# Altium project lga1700.PrjPCB (part 7 of 11)

## Sheet LAN - RTL8111H.schdoc
size 420 x 298 mm; Symbol: Sheet-Symbol_A3; Company: 嘉立创EDA; Version: V1.0; Page Size: A3; @Project Name: 【全网首发】X86电脑主板_copy; @Page Count: 15; @Update Date: 2025-10-09; @Create Date: 2025-10-09; @Schematic Name: SCHEMATIC1_1; @Page No: 0; @Page Name: LAN - RTL8111H; Device: Sheet-Symbol_A3
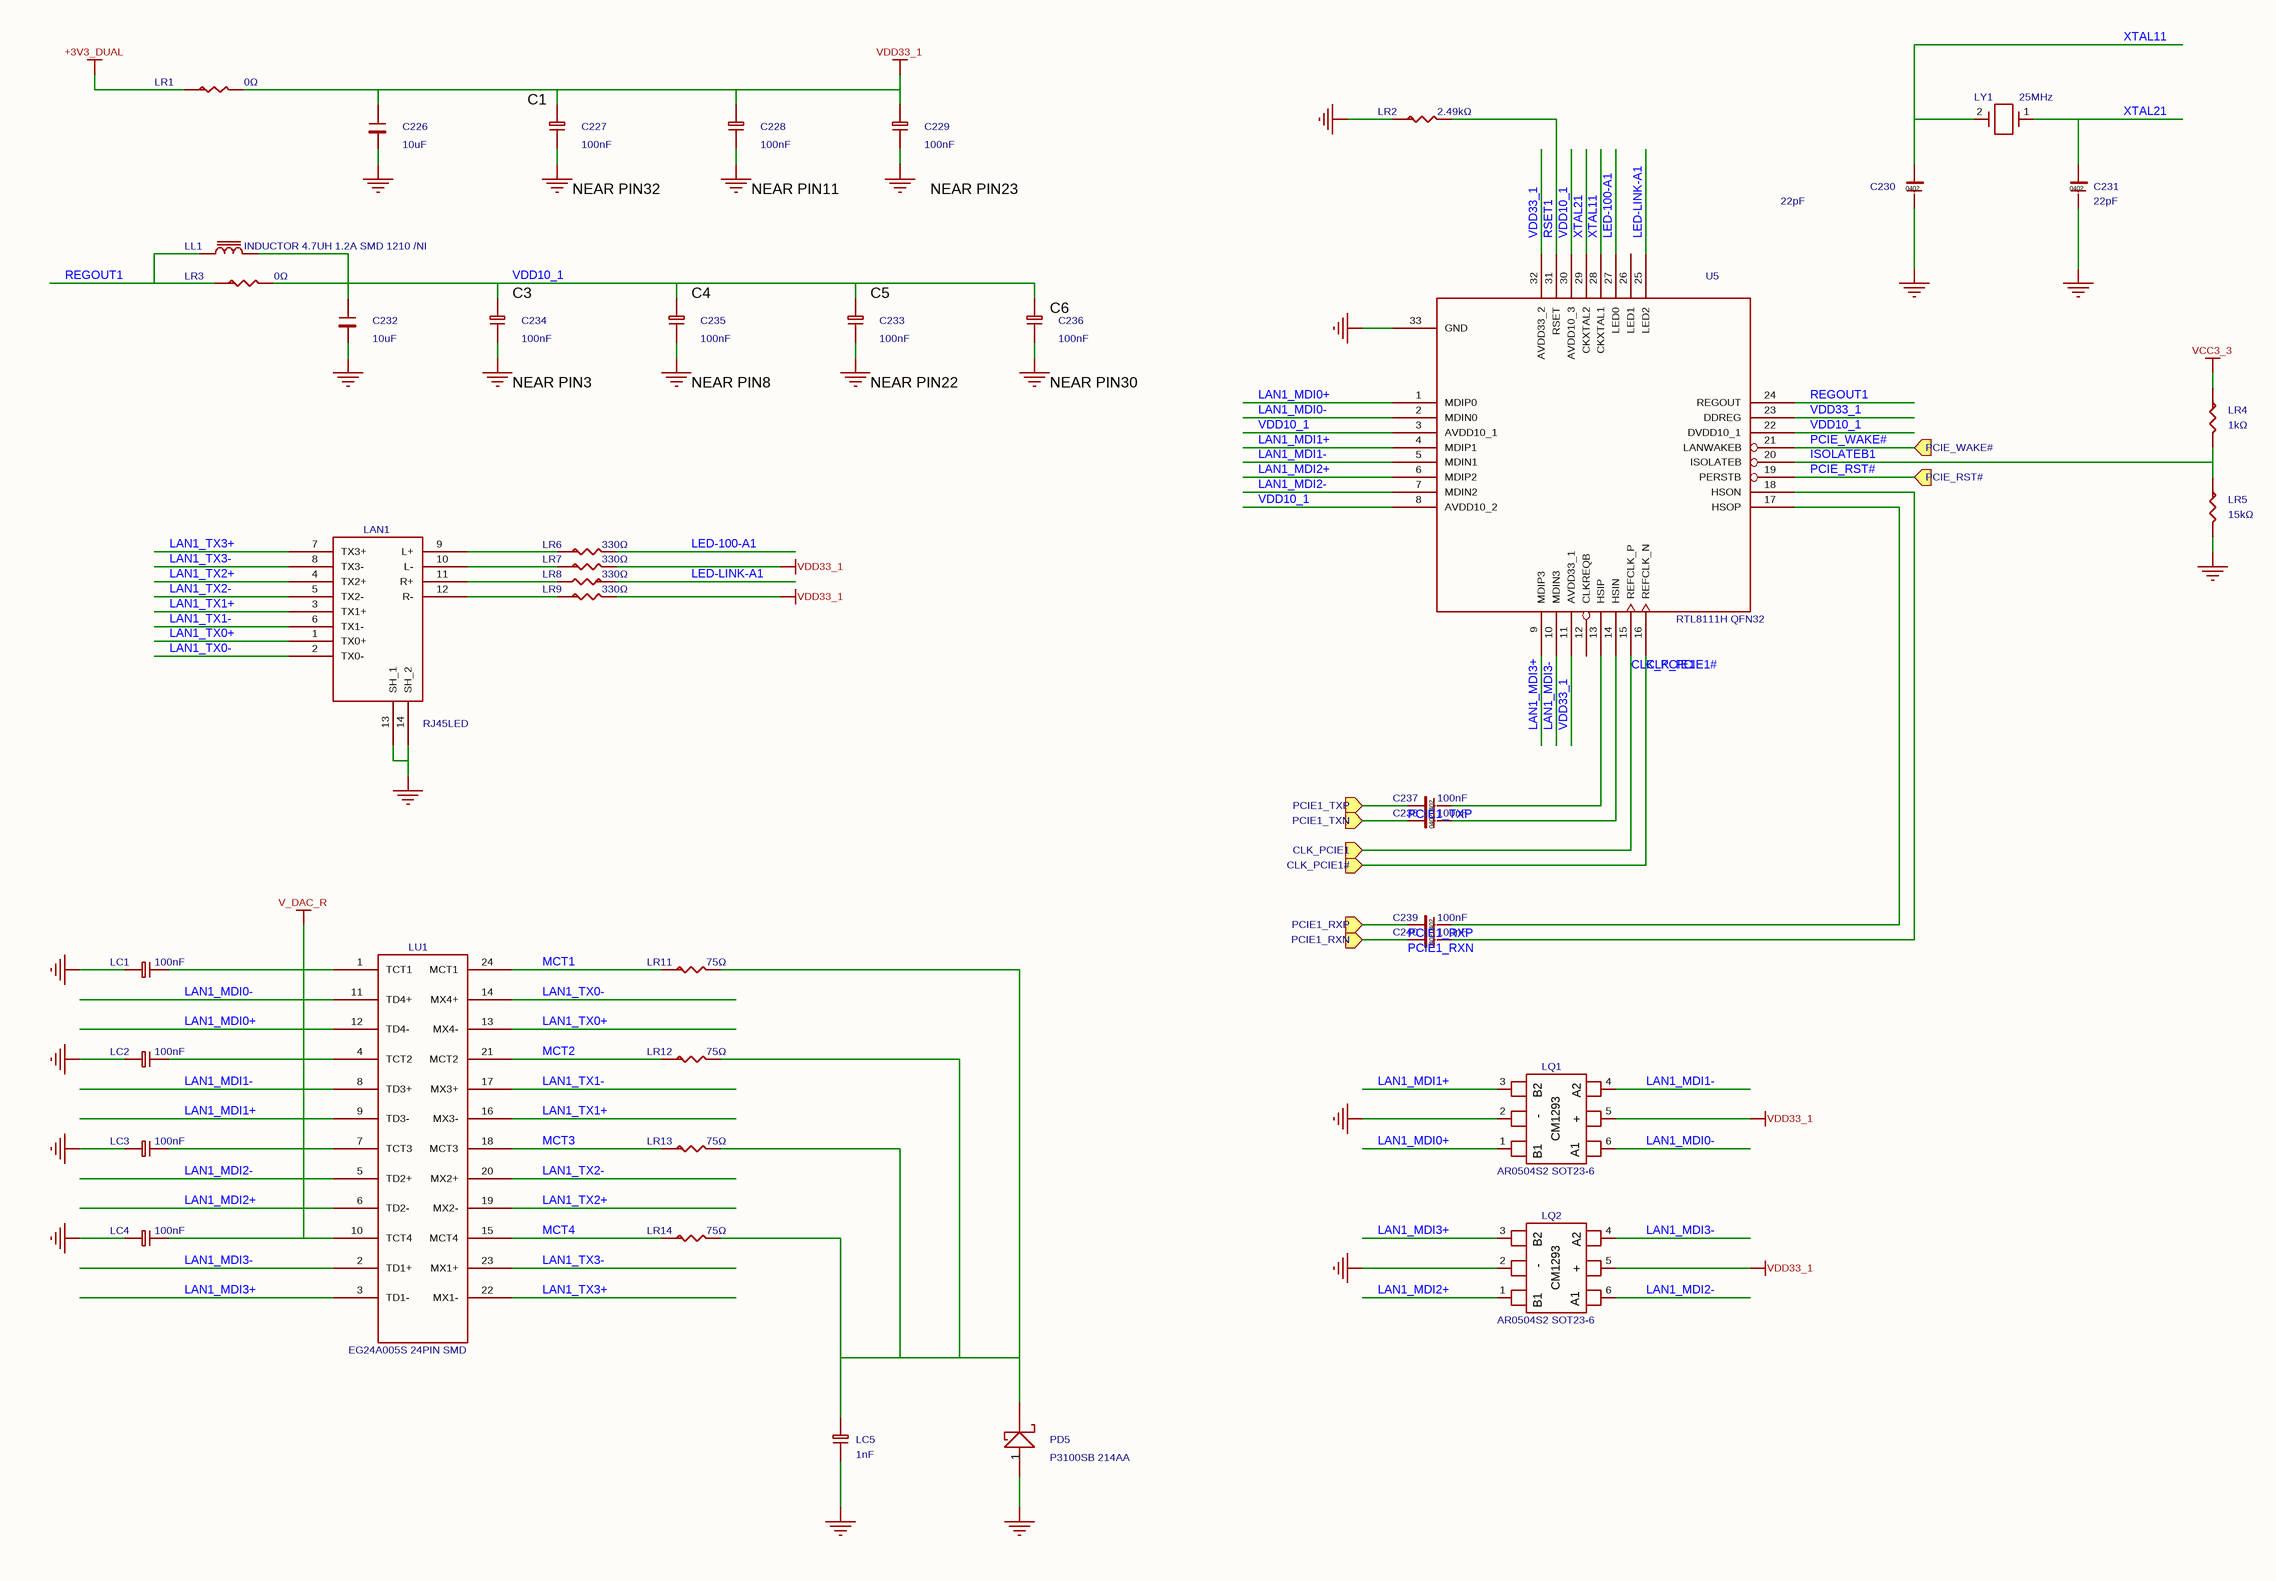
[diagram p25: LAN - RTL8111H.schdoc]

### Parts
C226  10uF  [C0603]
C227  100nF  [C0402]
C228  100nF  [C0402_3]
C229  100nF  [C0402_2]
C230  22pF  [C0402]
C231  22pF  [C0402]
C232  10uF  [C0603_3]
C233  100nF  [C0402_3]
C234  100nF  [C0402_2]
C235  100nF  [C0402_1]
C236  100nF  [C0402_1]
C237  100nF  [C0402_3]
C238  100nF  [C0402_3]
C239  100nF  [C0402_3]
C240  100nF  [C0402_3]
LAN1  value RJ45LED  [RJ45_LED]  (hidden comment: R-RJ45R08P-C000)
LC1  100nF  [C0402]
LC2  100nF  [C0402]
LC3  100nF  [C0402]
LC4  100nF  [C0402]
LC5  1nF  [C1206]
LL1  value INDUCTOR 4.7UH 1.2A SMD 1210 /NI  [L1210H22]  (hidden comment: INDUCTOR_0)
LQ1  value AR0504S2 SOT23-6  [SOT23-6P-20051228]  (hidden comment: SRV05-4)
LQ2  value AR0504S2 SOT23-6  [SOT23-6P-20051228]  (hidden comment: SRV05-4)
LR1  0Ω  [R0603]
LR2  2.49kΩ  [R0402]
LR3  0Ω  [R0603_1]
LR4  1kΩ  [R0402_1]
LR5  15kΩ  [R0402_3]
LR6  330Ω  [R0402_3]
LR7  330Ω  [R0402_1]
LR8  330Ω  [R0402_1]
LR9  330Ω  [R0402_1]
LR11  75Ω  [R0402_3]
LR12  75Ω  [R0402_1]
LR13  75Ω  [R0402_1]
LR14  75Ω  [R0402_1]
LU1  value EG24A005S 24PIN SMD  [TRAN24_100_150]  (hidden comment: RJ45LED_3)
LY1  25MHz  [XD2]
PD5  value P3100SB 214AA  [DIODE_1N5817]  (hidden comment: P3100SB)
U5  value RTL8111H QFN32  [RTL8111G_QFN32]  (hidden comment: RTL8111H-CG)

### Ports
CLK_PCIE1 (in), CLK_PCIE1# (in), PCIE1_RXN (in), PCIE1_RXP (in), PCIE1_TXN (in), PCIE1_TXP (in), PCIE_RST# (in), PCIE_WAKE# (in)

### Nets
+3V3_DUAL: LR1.1
GND: C226.1 C227.1 C228.1 C229.1 C230.2 C231.2 C232.1 C233.1 C234.1 C235.1 C236.1 LAN1.13(SH_1) LAN1.14(SH_2) LC1.2 LC2.2 LC3.2 LC4.2 LC5.1 LQ1.2 LQ2.2 LR2.1 LR5.2 PD5.1(A) U5.33(GND)
V_DAC_R: LC1.1 LC2.1 LC3.1 LC4.1 LU1.1(TCT1) LU1.4(TCT2) LU1.7(TCT3) LU1.10(TCT4)
VCC3_3: LR4.1
VDD33_1: C226.2 C227.2 C228.2 C229.2 LQ1.5(+) LQ2.5(+) LR1.2 LR7.2 LR9.2 U5.11(AVDD33_1) U5.23(DDREG) U5.32(AVDD33_2)
CLK_PCIE1: U5.15(REFCLK_P) ; port CLK_PCIE1
CLK_PCIE1#: U5.16(REFCLK_N) ; port CLK_PCIE1#
ISOLATEB1: LR4.2 LR5.1 U5.20(ISOLATEB)
LAN1_MDI0+: LQ1.1 LU1.12(TD4-) U5.1(MDIP0)
LAN1_MDI0-: LQ1.6 LU1.11(TD4+) U5.2(MDIN0)
LAN1_MDI1+: LQ1.3 LU1.9(TD3-) U5.4(MDIP1)
LAN1_MDI1-: LQ1.4 LU1.8(TD3+) U5.5(MDIN1)
LAN1_MDI2+: LQ2.1 LU1.6(TD2-) U5.6(MDIP2)
LAN1_MDI2-: LQ2.6 LU1.5(TD2+) U5.7(MDIN2)
LAN1_MDI3+: LQ2.3 LU1.3(TD1-) U5.9(MDIP3)
LAN1_MDI3-: LQ2.4 LU1.2(TD1+) U5.10(MDIN3)
LAN1_TX0+: LAN1.1(TX0+) LU1.13(MX4-)
LAN1_TX0-: LAN1.2(TX0-) LU1.14(MX4+)
LAN1_TX1+: LAN1.3(TX1+) LU1.16(MX3-)
LAN1_TX1-: LAN1.6(TX1-) LU1.17(MX3+)
LAN1_TX2+: LAN1.4(TX2+) LU1.19(MX2-)
LAN1_TX2-: LAN1.5(TX2-) LU1.20(MX2+)
LAN1_TX3+: LAN1.7(TX3+) LU1.22(MX1-)
LAN1_TX3-: LAN1.8(TX3-) LU1.23(MX1+)
LED-100-A1: LR6.2 U5.27(LED0)
LED-LINK-A1: LR8.1 U5.25(LED2)
MCT1: LR11.1 LU1.24(MCT1)
MCT2: LR12.1 LU1.21(MCT2)
MCT3: LR13.1 LU1.18(MCT3)
MCT4: LR14.1 LU1.15(MCT4)
PCIE1_RXN: C240.1 ; port PCIE1_RXN
PCIE1_RXP: C239.1 ; port PCIE1_RXP
PCIE1_TXN: C238.1 ; port PCIE1_TXN
PCIE1_TXP: C237.1 ; port PCIE1_TXP
PCIE_RST#: U5.19(PERSTB) ; port PCIE_RST#
PCIE_WAKE#: U5.21(LANWAKEB) ; port PCIE_WAKE#
REGOUT1: LL1.1 LR3.1 U5.24(REGOUT)
RSET1: LR2.2 U5.31(RSET)
VDD10_1: C232.2 C233.2 C234.2 C235.2 C236.2 LL1.2 LR3.2 U5.3(AVDD10_1) U5.8(AVDD10_2) U5.22(DVDD10_1) U5.30(AVDD10_3)
XTAL11: C230.1 LY1.2 U5.28(CKXTAL1)
XTAL21: C231.1 LY1.1 U5.29(CKXTAL2)
NetC237_2: C237.2 U5.13(HSIP)
NetC238_2: C238.2 U5.14(HSIN)
NetC239_2: C239.2 U5.17(HSOP)
NetC240_2: C240.2 U5.18(HSON)
NetLAN1_9: LAN1.9(L+) LR6.1
NetLAN1_10: LAN1.10(L-) LR7.1
NetLAN1_11: LAN1.11(R+) LR8.2
NetLAN1_12: LAN1.12(R-) LR9.1
NetLC5_2: LC5.2 LR11.2 LR12.2 LR13.2 LR14.2 PD5.2(C)

Not connected (* = marked no-connect by the designer): U5 12(CLKREQB) 26(LED1)

### Notes on the sheet
- (near C227) C1
- (near C227) NEAR PIN32
- (near C228) NEAR PIN11
- (near C229) NEAR PIN23
- (near C234) C3
- (near C235) C4
- (near C233) C5
- (near C236) C6
- (near C234) NEAR PIN3
- (near C235) NEAR PIN8
- (near C233) NEAR PIN22
- (near C236) NEAR PIN30
- 更新日期
- 2025-10-09
- 原理图
- 图页
- SCHEMATIC1_1
- LAN - RTL8111H
- 创建日期
- 物料编码
- 审阅
- 绘制
- 【全网首发】X86电脑主板_copy
- 版本
- V1.0
- 尺寸
- A3
- 页
- 0
- 嘉立创EDA
- 共
- 15
- (in symbol SRV05-4_C558418) B2; A2; CM1293; -; B1; A1

### Library data of the parts
C226 C232 = CL10A106KP8NNNC: 容值:10uF;精度:±10%;额定电压:10V;材质(温度系数):X5R;; Manufacturer: SAMSUNG(三星); Symbol: C0805; ModelId: ac125912035d415993ca9572d50418b1; Tolerance: ±10%; AddInBom: yes; Voltage Rated: 10V; ModelName: C0603_L1.6-W0.8-H0.8; ModelTransform: 62.992,31.496,0,0,0,0,0,0,0; Temperature Coefficient: X5R; Device: CL10A106KP8NNNC; Value: 10uF; Supplier: LCSC; Datasheet: https://atta.szlcsc.com/upload/public/pdf/source/20160103/1457707703378.pdf; SupplierPart: C19702; ConvertToPcb: yes; LCSC Part Name: 10uF ±10% 10V; JLCPCB Part Class: Basic Part; ManufacturerPart: CL10A106KP8NNNC; Supplier Footprint: 0603
  C226: FootprintName: C0603
  C232: FootprintName: C0603_3
C227-C229 C233-C236 LC1-LC4 = CC0402KRX7R7BB104: 容值:100nF;精度:±10%;额定电压:16V;材质(温度系数):X7R;; Manufacturer: YAGEO(国巨); Symbol: CAP NP_21; ModelId: 36a51122f27c49738f86b3bfa98863e0; Tolerance: ±10%; AddInBom: yes; Voltage Rated: 16V; ModelName: C0402_L1.0-W0.5-H0.5; ModelTransform: 39.37,19.685,0,0,0,0,0,0,0; Temperature Coefficient: X7R; Device: CC0402KRX7R7BB104; Value: 100nF; Supplier: LCSC; Datasheet: https://atta.szlcsc.com/upload/public/pdf/source/20211223/9278FD768280B81DDBEF48FA36411A03.pdf; SupplierPart: C60474; ConvertToPcb: yes; LCSC Part Name: 100nF ±10% 16V; JLCPCB Part Class: Extended Part; ManufacturerPart: CC0402KRX7R7BB104; Supplier Footprint: 0402
  C227 LC1-LC4: FootprintName: C0402
  C228 C233: FootprintName: C0402_3
  C229 C234: FootprintName: C0402_2
  C235 C236: FootprintName: C0402_1
C230 C231 = 0402CG220J500NT: 容值:22pF;精度:±5%;额定电压:50V;材质(温度系数):C0G;; Manufacturer: FH(风华); ModelId: 36a51122f27c49738f86b3bfa98863e0; Tolerance: ±5%; AddInBom: yes; Voltage Rated: 50V; ModelName: C0402_L1.0-W0.5-H0.5; ModelTransform: 39.37,19.685,0,0,0,0,0,0,0; Temperature Coefficient: C0G; Device: 0402CG220J500NT; Symbol: C0402; Value: 22pF; Supplier: LCSC; Datasheet: https://atta.szlcsc.com/upload/public/pdf/source/20200305/C486355_26A10D38EF8C2A5C37091D0039909270.pdf; FootprintName: C0402; SupplierPart: C1555; ConvertToPcb: yes; LCSC Part Name: 22pF ±5% 50V; JLCPCB Part Class: Basic Part; ManufacturerPart: 0402CG220J500NT; Supplier Footprint: 0402
C237-C240 = CL05B104KO5NNNC: 容值:100nF;精度:±10%;额定电压:16V;材质(温度系数):X7R;; Manufacturer: SAMSUNG(三星); Symbol: C0402; ModelId: 36a51122f27c49738f86b3bfa98863e0; Tolerance: ±10%; AddInBom: yes; Voltage Rated: 16V; ModelName: C0402_L1.0-W0.5-H0.5; ModelTransform: 39.37,19.685,0,0,0,0,0,0,0; Temperature Coefficient: X7R; Device: CL05B104KO5NNNC; Value: 100nF; Supplier: LCSC; Datasheet: https://atta.szlcsc.com/upload/public/pdf/source/20160103/1457707674891.pdf; FootprintName: C0402_3; SupplierPart: C1525; ConvertToPcb: yes; LCSC Part Name: 100nF ±10% 16V; JLCPCB Part Class: Basic Part; ManufacturerPart: CL05B104KO5NNNC; Supplier Footprint: 0402
LAN1 = R-RJ45R08P-C000: 连接器类型:RJ插座;USOC代码:RJ45;端口数量:1;等级:-;安装方式:弯插;屏蔽:有;LED:带LED;工作温度范围:0℃~+70℃;; Manufacturer: Ckmtw(灿科盟); Symbol: RJ45LED_0; LED: 带LED; ModelId: 7d68f79fef814152a52c058157038b8b; Shielding: 有; USOC Codes: RJ45; AddInBom: yes; ModelName: RJ45-TH_L16.3-W15.8-H13.1; Connector Type: RJ插座; Number of Ports: 1; ModelTransform: 647.6365,631.889,0,0,0,0,0,-129.921,-137.795; Device: R-RJ45R08P-C000; Ratings: -; Supplier: LCSC; Datasheet: https://atta.szlcsc.com/upload/public/pdf/source/20190508/C386757_590BCC8A33AAEEF7838490D656B2E4CF.pdf; FootprintName: RJ45_LED; SupplierPart: C386757; ConvertToPcb: yes; LCSC Part Name: RJ45 弯插 带LED 8P/8C 铜壳带屏蔽 短体  无弹片; Mounting Style: 弯插; JLCPCB Part Class: Extended Part; ManufacturerPart: R-RJ45R08P-C000; Supplier Footprint: 插件; Operating Temperature Range: 0℃~+70℃
LC5 = 1206B102K202NT: 容值:1nF;精度:±10%;额定电压:2kV;材质(温度系数):X7R;; Manufacturer: FH(风华); Symbol: CAP NP_21; ModelId: e4be705b945545a48e666415e3682bd8; Tolerance: ±10%; AddInBom: yes; Voltage Rated: 2kV; ModelName: C1206_L3.2-W1.6-H1.3; ModelTransform: 125.984,62.992,0,0,0,0,0,0,0; Temperature Coefficient: X7R; Device: 1206B102K202NT; Value: 1nF; Supplier: LCSC; Datasheet: https://atta.szlcsc.com/upload/public/pdf/source/20170923/C9196_1506149572183988986.pdf; FootprintName: C1206; SupplierPart: C9196; ConvertToPcb: yes; LCSC Part Name: 1nF ±10% 2kV; JLCPCB Part Class: Basic Part; ManufacturerPart: 1206B102K202NT; Supplier Footprint: 1206
LL1 = INDUCTOR_0: Manufacturer: UNI-ROYAL(厚声); Manufacturer Part: 0603WAF0000T5E; 3D Model: fc143cca1e79419f9cd78b61e9279f08; 3D Model Transform: 31.8897,63.7794,0,90,0,0,0,0,0; Tolerance: ±1%; Power(Watts): 100mW; Overload Voltage (Max): 75V; AddInBom: yes; Device: INDUCTOR_0; Symbol: INDUCTOR_0; LCSC Part Name: 0Ω ±1% 100mW 厚膜电阻; Supplier Part: C21189; Supplier Footprint: 0603; JLCPCB Part Class: Basic Part; Datasheet: https://atta.szlcsc.com/upload/public/pdf/source/20200306/C422600_1E6D84923E4A46A82E41ADD87F860B5C.pdf; Supplier: LCSC; Type: 厚膜电阻; Operating Temperature Range: -55℃~+155℃; FootprintName: L1210H22; ConvertToPcb: yes
LQ1 LQ2 = SRV05-4_C558418: 反向截止电压(Vrwm):5V;最大钳位电压:20V;峰值脉冲电流(Ipp)@10/1000us:3A;击穿电压:6V;; Manufacturer: TECH PUBLIC(台舟); Symbol: CM1293_0; AddInBom: yes; ModelId: 18da8f6c14a34920b3e136b5c401a119; ModelName: SOT-23-6_L2.9-W1.6-H1.5-LS2.8-P0.95; ModelTransform: 110.236,113.364,0,90,0,0,0.0005,0.0005,0; Reverse Stand-Off Voltage (Vrwm): 5V; Maximum Clamping Voltage: 20V; Peak Pulse Current (Ipp)@10/1000us: 3A; Breakdown Voltage: 6V; Device: SRV05-4_C558418; LCSC Part Name: ESD，可防25kV静电; SupplierPart: C558418; ManufacturerPart: SRV05-4; Supplier Footprint: SOT-23-6; JLCPCB Part Class: Extended Part; Datasheet: https://atta.szlcsc.com/upload/public/pdf/source/20230615/CFFDFFE99FDA0E92DF9600783B3A2A20.pdf; Supplier: LCSC; ConvertToPcb: yes; FootprintName: SOT23-6P-20051228; Type: ESD
LR1 = 0603WAF0000T5E: 电阻类型:厚膜电阻;阻值:0Ω;精度:±1%;功率:100mW;; Manufacturer: UNI-ROYAL(厚声); Symbol: R-0603; ModelId: fc143cca1e79419f9cd78b61e9279f08; Tolerance: ±1%; AddInBom: yes; Power(Watts): 100mW; ModelTransform: 31.8897,63.7794,0,90,0,0,0,0,0; Overload Voltage (Max): 75V; Device: 0603WAF0000T5E; Value: 0Ω; Type: 厚膜电阻; Supplier: LCSC; Datasheet: https://atta.szlcsc.com/upload/public/pdf/source/20200306/C422600_1E6D84923E4A46A82E41ADD87F860B5C.pdf; FootprintName: R0603; SupplierPart: C21189; ModelName: R0603; ConvertToPcb: yes; LCSC Part Name: 0Ω ±1% 100mW; JLCPCB Part Class: Basic Part; ManufacturerPart: 0603WAF0000T5E; Supplier Footprint: 0603; Operating Temperature Range: -55℃~+155℃
LR2 = 0402WGF2491TCE: 电阻类型:厚膜电阻;阻值:2.49kΩ;精度:±1%;功率:62.5mW;; Manufacturer: UNI-ROYAL(厚声); Symbol: R-0603; ModelId: 671aefced39d4c318694bba8bd8efd39; Tolerance: ±1%; AddInBom: yes; Power(Watts): 62.5mW; ModelName: R0402_L1.0-W0.5-H0.5; ModelTransform: 39.37,19.685,0,0,0,0,0,0.0005,0; Overload Voltage (Max): 50V; Temperature Coefficient: ±100ppm/℃; Device: 0402WGF2491TCE; Value: 2.49kΩ; Type: 厚膜电阻; Supplier: LCSC; Datasheet: https://atta.szlcsc.com/upload/public/pdf/source/20200306/C422600_1E6D84923E4A46A82E41ADD87F860B5C.pdf; FootprintName: R0402; SupplierPart: C25884; ConvertToPcb: yes; LCSC Part Name: 2.49kΩ ±1% 62.5mW; JLCPCB Part Class: Extended Part; ManufacturerPart: 0402WGF2491TCE; Supplier Footprint: 0402; Operating Temperature Range: -55℃~+155℃
LR3 = 0603WAF0000T5E: 电阻类型:厚膜电阻;阻值:0Ω;精度:±1%;功率:100mW;; Manufacturer: UNI-ROYAL(厚声); Symbol: R-0603; ModelId: fc143cca1e79419f9cd78b61e9279f08; Tolerance: ±1%; AddInBom: yes; Power(Watts): 100mW; ModelName: R0603; ModelTransform: 31.8897,63.7794,0,90,0,0,0,0,0; Overload Voltage (Max): 75V; Device: 0603WAF0000T5E; Value: 0Ω; Type: 厚膜电阻; Supplier: LCSC; Datasheet: https://atta.szlcsc.com/upload/public/pdf/source/20200306/C422600_1E6D84923E4A46A82E41ADD87F860B5C.pdf; FootprintName: R0603_1; SupplierPart: C21189; ConvertToPcb: yes; LCSC Part Name: 0Ω ±1% 100mW; JLCPCB Part Class: Basic Part; ManufacturerPart: 0603WAF0000T5E; Supplier Footprint: 0603; Operating Temperature Range: -55℃~+155℃
LR4 = 0402WGF1001TCE: 电阻类型:厚膜电阻;阻值:1kΩ;精度:±1%;功率:62.5mW;; Manufacturer: UNI-ROYAL(厚声); Symbol: R-0603; ModelId: 671aefced39d4c318694bba8bd8efd39; Tolerance: ±1%; AddInBom: yes; Power(Watts): 62.5mW; ModelName: R0402_L1.0-W0.5-H0.5; ModelTransform: 39.37,19.685,0,0,0,0,0,0.0005,0; Overload Voltage (Max): 50V; Temperature Coefficient: ±100ppm/℃; Device: 0402WGF1001TCE; Value: 1kΩ; Type: 厚膜电阻; Supplier: LCSC; Datasheet: https://atta.szlcsc.com/upload/public/pdf/source/20200306/C422600_1E6D84923E4A46A82E41ADD87F860B5C.pdf; FootprintName: R0402_1; SupplierPart: C11702; ConvertToPcb: yes; LCSC Part Name: 1kΩ ±1% 62.5mW; JLCPCB Part Class: Basic Part; ManufacturerPart: 0402WGF1001TCE; Supplier Footprint: 0402; Operating Temperature Range: -55℃~+155℃
LR5 = 0402WGF1502TCE: 电阻类型:厚膜电阻;阻值:15kΩ;精度:±1%;功率:62.5mW;; Manufacturer: UNI-ROYAL(厚声); Symbol: R-0603; ModelId: 671aefced39d4c318694bba8bd8efd39; Tolerance: ±1%; AddInBom: yes; Power(Watts): 62.5mW; ModelName: R0402_L1.0-W0.5-H0.5; ModelTransform: 39.37,19.685,0,0,0,0,0,0.0005,0; Overload Voltage (Max): 50V; Temperature Coefficient: ±100ppm/℃; Device: 0402WGF1502TCE; Value: 15kΩ; Type: 厚膜电阻; Supplier: LCSC; Datasheet: https://atta.szlcsc.com/upload/public/pdf/source/20200306/C422600_1E6D84923E4A46A82E41ADD87F860B5C.pdf; FootprintName: R0402_3; SupplierPart: C25756; ConvertToPcb: yes; LCSC Part Name: 15kΩ ±1% 62.5mW; JLCPCB Part Class: Basic Part; ManufacturerPart: 0402WGF1502TCE; Supplier Footprint: 0402; Operating Temperature Range: -55℃~+155℃
LR6-LR9 = 0402WGF3300TCE: 电阻类型:厚膜电阻;阻值:330Ω;精度:±1%;功率:62.5mW;; Manufacturer: UNI-ROYAL(厚声); Symbol: R-0603; ModelId: 671aefced39d4c318694bba8bd8efd39; Tolerance: ±1%; AddInBom: yes; Power(Watts): 62.5mW; ModelName: R0402_L1.0-W0.5-H0.5; ModelTransform: 39.37,19.685,0,0,0,0,0,0.0005,0; Overload Voltage (Max): 50V; Temperature Coefficient: ±100ppm/℃; Device: 0402WGF3300TCE; Value: 330Ω; Type: 厚膜电阻; Supplier: LCSC; Datasheet: https://atta.szlcsc.com/upload/public/pdf/source/20200306/C422600_1E6D84923E4A46A82E41ADD87F860B5C.pdf; SupplierPart: C25104; ConvertToPcb: yes; LCSC Part Name: 330Ω ±1% 62.5mW; JLCPCB Part Class: Basic Part; ManufacturerPart: 0402WGF3300TCE; Supplier Footprint: 0402; Operating Temperature Range: -55℃~+155℃
  LR6: FootprintName: R0402_3
  LR7-LR9: FootprintName: R0402_1
LR11-LR14 = 0402WGF750JTCE: 电阻类型:厚膜电阻;阻值:75Ω;精度:±1%;功率:62.5mW;; Manufacturer: UNI-ROYAL(厚声); Symbol: R-0603; ModelId: 671aefced39d4c318694bba8bd8efd39; Tolerance: ±1%; AddInBom: yes; Power(Watts): 62.5mW; ModelName: R0402_L1.0-W0.5-H0.5; ModelTransform: 39.37,19.685,0,0,0,0,0,0.0005,0; Overload Voltage (Max): 50V; Temperature Coefficient: ±100ppm/℃; Device: 0402WGF750JTCE; Value: 75Ω; Type: 厚膜电阻; Supplier: LCSC; Datasheet: https://atta.szlcsc.com/upload/public/pdf/source/20200306/C422600_1E6D84923E4A46A82E41ADD87F860B5C.pdf; SupplierPart: C25133; ConvertToPcb: yes; LCSC Part Name: 75Ω ±1% 62.5mW; JLCPCB Part Class: Basic Part; ManufacturerPart: 0402WGF750JTCE; Supplier Footprint: 0402; Operating Temperature Range: -55℃~+155℃
  LR11: FootprintName: R0402_3
  LR12-LR14: FootprintName: R0402_1
LU1 = RJ45LED_3: AddInBom: yes; Device: RJ45LED_3; Symbol: RJ45LED_3; Supplier Part: C9900052919; FootprintName: TRAN24_100_150; ConvertToPcb: yes
LY1 = X49SD25MSD2SC: 频率:25MHz;频率公差:±20ppm;负载电容:20pF;; Manufacturer: YXC(扬兴晶振); Symbol: CRYSTAL_0; ModelId: a8e34f6c394c4d60ace7720f62d1ccdf; AddInBom: yes; Crystal Type: 49S晶振; ModelName: HC-49US_L11.0-W4.5-H3.5-P4.88; Load Capacitance: 20pF; ModelTransform: 432.46488,177.165,0,0,0,0,0,0,-137.795; Frequency Stability: ±30ppm; Frequency Tolerance: ±20ppm; Device: X49SD25MSD2SC; Value: 25MHz; Supplier: LCSC; Datasheet: https://atta.szlcsc.com/upload/public/pdf/source/20210903/A997D130AE99CBB55D9024F9BE6DA174.pdf; FootprintName: XD2; SupplierPart: C14730; ConvertToPcb: yes; LCSC Part Name: 25MHz ±20ppm 20pF HC-49US; JLCPCB Part Class: Extended Part; ManufacturerPart: X49SD25MSD2SC; Supplier Footprint: HC-49S; Operating Temperature: -20℃~+70℃
PD5 = P3100SB_C3012560: 断态峰值电压(Vdrm):275V;开关电压(Vs):350V;漏电流(Idrm):5uA;维持电流(Ih):120mA;; Manufacturer: PAKER(派克微); Symbol: DIODE SCHOTTKY; AddInBom: yes; ModelId: 07b8d28694b84373acb83e050c4644c9; ModelName: SMB_L4.6-W3.6-LS5.3-BI; ModelTransform: 212.598,141.732,0,0,0,0,0,0,0; Peak off-state voltage: 275V; Switching Voltage (Vs): 350V; Peak Pulse Current-Ipp (10/1000us): 80A; Off-state current: 5uA; Holding Current (Ih): 120mA; On-state Voltage (Vt): 4V; On-state Current (It): 2.2A; Off-state Capacitance (Co): 52pF; Device: P3100SB_C3012560; PCB Footprint: DIODE_1N5817; LCSC Part Name: P3100SB; SupplierPart: C3012560; ManufacturerPart: P3100SB; Supplier Footprint: SMB; JLCPCB Part Class: Extended Part; Datasheet: https://atta.szlcsc.com/upload/public/pdf/source/20220607/CB91779BA710CEF1D2CD73D5C8C563CB.pdf; Supplier: LCSC; ConvertToPcb: yes; FootprintName: DIODE_1N5817
U5 = RTL8111H-CG: Manufacturer: REALTEK(瑞昱); Symbol: RL5877_0; AddInBom: yes; ModelId: c3a043996fff46968cb9e2e6abede9b6; ModelName: QFN-32_L4.0-W4.0-H0.8-P0.40-BL-EP2.8; ModelTransform: 157.48,157.48,0,0,0,0,-0.002,-0.007,0; Device: RTL8111H-CG; LCSC Part Name: RTL8111H-CG; SupplierPart: C2761340; ManufacturerPart: RTL8111H-CG; Supplier Footprint: QFN-32-EP(4x4); JLCPCB Part Class: Extended Part; Datasheet: https://atta.szlcsc.com/upload/public/pdf/source/20210810/FF05C5D46F518898BC2EC053E52D54B5.pdf; Supplier: LCSC; ConvertToPcb: yes; FootprintName: RTL8111G_QFN32

## Sheet M.2_SATA_SLOT.schdoc
size 420 x 298 mm; Symbol: Sheet-Symbol_A3; Company: 嘉立创EDA; Version: V1.0; Page Size: A3; @Project Name: 【全网首发】X86电脑主板_copy; @Page Count: 18; @Update Date: 2025-10-09; @Create Date: 2025-10-09; @Schematic Name: SCHEMATIC1_1; @Page No: 0; @Page Name: M.2_SATA_SLOT; Device: Sheet-Symbol_A3
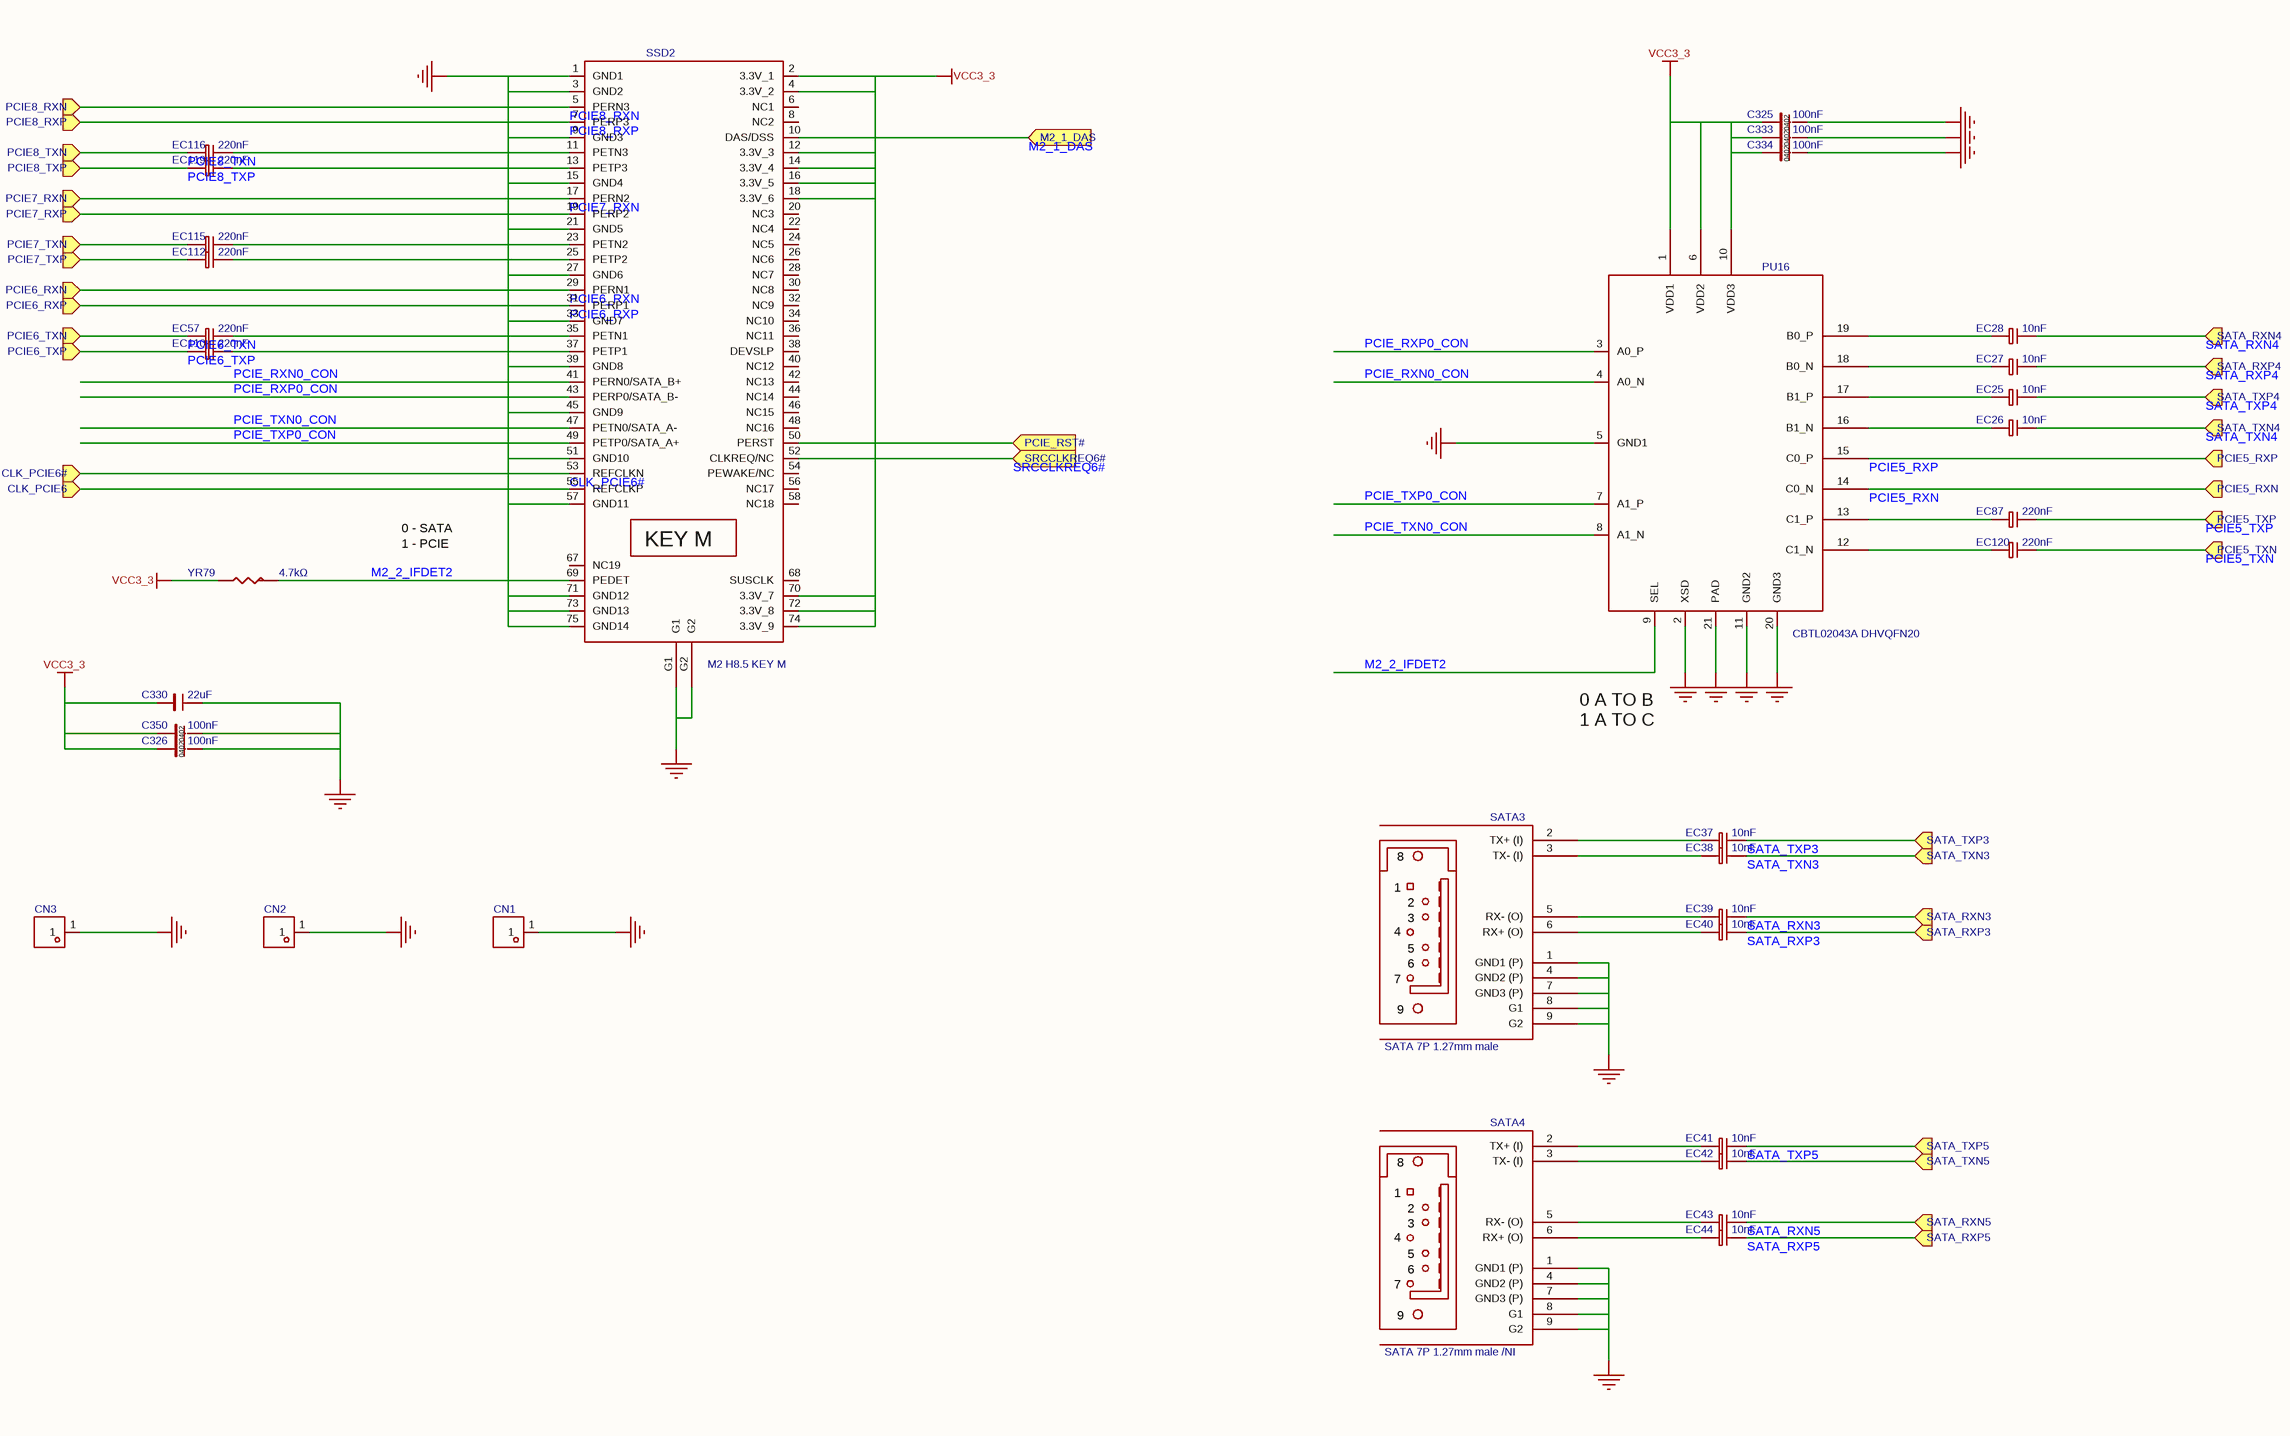
[diagram p26: M.2_SATA_SLOT.schdoc]

### Parts
C325  100nF  [C0402_1]
C326  100nF  [C0402_2]
C330  22uF  [C0603_3]
C333  100nF  [C0402_3]
C334  100nF  [C0402]
C350  100nF  [C0402_2]
CN1  SMTSOM270BTR  [SMD_BD5.6-D3.6]  (value not drawn)
CN2  SMTSOM270BTR  [SMD_BD5.6-D3.6]  (value not drawn)
CN3  SMTSOM270BTR  [SMD_BD5.6-D3.6]  (value not drawn)
EC25  10nF  [C0402_1]
EC26  10nF  [C0402_1]
EC27  10nF  [C0402_1]
EC28  10nF  [C0402_1]
EC37  10nF  [C0402_2]
EC38  10nF  [C0402_2]
EC39  10nF  [C0402_2]
EC40  10nF  [C0402_2]
EC41  10nF  [C0402_2]
EC42  10nF  [C0402_2]
EC43  10nF  [C0402_2]
EC44  10nF  [C0402_2]
EC57  220nF  [C0402_2]
EC87  220nF  [C0402_1]
EC110  220nF  [C0402_2]
EC112  220nF  [C0402_2]
EC115  220nF  [C0402_2]
EC116  220nF  [C0402_2]
EC119  220nF  [C0402_2]
EC120  220nF  [C0402_1]
PU16  value CBTL02043A DHVQFN20  [DHVQFN20]  (hidden comment: CBTL02043ABQ,115)
SATA3  value SATA 7P 1.27mm male  [SATA_D_AKL]  (hidden comment: LE18077-Z54D-4H)
SATA4  value SATA 7P 1.27mm male /NI  [SATA_D_AKL]  (hidden comment: LE18077-Z54D-4H)
SSD2  value M2 H8.5 KEY M  [SMD-NGFF-75P-M2-H3-LOTES]  (hidden comment: 91302-67-067R2M)
YR79  4.7kΩ  [R0402]

### Ports
CLK_PCIE6 (in), CLK_PCIE6# (in), M2_1_DAS (in), PCIE5_RXN (in), PCIE5_RXP (in), PCIE5_TXN (in), PCIE5_TXP (in), PCIE6_RXN (in), PCIE6_RXP (in), PCIE6_TXN (in), PCIE6_TXP (in), PCIE7_RXN (in), PCIE7_RXP (in), PCIE7_TXN (in), PCIE7_TXP (in), PCIE8_RXN (in), PCIE8_RXP (in), PCIE8_TXN (in), PCIE8_TXP (in), PCIE_RST# (in), SATA_RXN3 (in), SATA_RXN4 (in), SATA_RXN5 (in), SATA_RXP3 (in), SATA_RXP4 (in), SATA_RXP5 (in), SATA_TXN3 (in), SATA_TXN4 (in), SATA_TXN5 (in), SATA_TXP3 (in), SATA_TXP4 (in), SATA_TXP5 (in), SRCCLKREQ6# (in)

### Nets
GND: C325.2 C326.2 C330.2 C333.2 C334.2 C350.2 CN1.1 CN2.1 CN3.1 PU16.2(XSD) PU16.5(GND1) PU16.11(GND2) PU16.20(GND3) PU16.21(PAD) SATA3.1(GND1_(P)) SATA3.4(GND2_(P)) SATA3.7(GND3_(P)) SATA3.8(G1) SATA3.9(G2) SATA4.1(GND1_(P)) SATA4.4(GND2_(P)) SATA4.7(GND3_(P)) SATA4.8(G1) SATA4.9(G2) SSD2.1(GND1) SSD2.3(GND2) SSD2.9(GND3) SSD2.15(GND4) SSD2.21(GND5) SSD2.27(GND6) SSD2.33(GND7) SSD2.39(GND8) SSD2.45(GND9) SSD2.51(GND10) SSD2.57(GND11) SSD2.71(GND12) SSD2.73(GND13) SSD2.75(GND14) SSD2.G1 SSD2.G2
VCC3_3: C325.1 C326.1 C330.1 C333.1 C334.1 C350.1 PU16.1(VDD1) PU16.6(VDD2) PU16.10(VDD3) SSD2.2(3.3V_1) SSD2.4(3.3V_2) SSD2.12(3.3V_3) SSD2.14(3.3V_4) SSD2.16(3.3V_5) SSD2.18(3.3V_6) SSD2.70(3.3V_7) SSD2.72(3.3V_8) SSD2.74(3.3V_9) YR79.2
CLK_PCIE6: SSD2.55(REFCLKP) ; port CLK_PCIE6
CLK_PCIE6#: SSD2.53(REFCLKN) ; port CLK_PCIE6#
M2_1_DAS: SSD2.10(DAS/DSS) ; port M2_1_DAS
M2_2_IFDET2: PU16.9(SEL) SSD2.69(PEDET) YR79.1
PCIE5_RXN: PU16.14(C0_N) ; port PCIE5_RXN
PCIE5_RXP: PU16.15(C0_P) ; port PCIE5_RXP
PCIE5_TXN: EC120.2 ; port PCIE5_TXN
PCIE5_TXP: EC87.2 ; port PCIE5_TXP
PCIE6_RXN: SSD2.29(PERN1) ; port PCIE6_RXN
PCIE6_RXP: SSD2.31(PERP1) ; port PCIE6_RXP
PCIE6_TXN: EC57.1 ; port PCIE6_TXN
PCIE6_TXP: EC110.1 ; port PCIE6_TXP
PCIE7_RXN: SSD2.17(PERN2) ; port PCIE7_RXN
PCIE7_RXP: SSD2.19(PERP2) ; port PCIE7_RXP
PCIE7_TXN: EC115.1 ; port PCIE7_TXN
PCIE7_TXP: EC112.1 ; port PCIE7_TXP
PCIE8_RXN: SSD2.5(PERN3) ; port PCIE8_RXN
PCIE8_RXP: SSD2.7(PERP3) ; port PCIE8_RXP
PCIE8_TXN: EC116.1 ; port PCIE8_TXN
PCIE8_TXP: EC119.1 ; port PCIE8_TXP
PCIE_RST#: SSD2.50(PERST) ; port PCIE_RST#
PCIE_RXN0_CON: PU16.4(A0_N) SSD2.41(PERN0/SATA_B+)
PCIE_RXP0_CON: PU16.3(A0_P) SSD2.43(PERP0/SATA_B-)
PCIE_TXN0_CON: PU16.8(A1_N) SSD2.47(PETN0/SATA_A-)
PCIE_TXP0_CON: PU16.7(A1_P) SSD2.49(PETP0/SATA_A+)
SATA_RXN3: EC39.2 ; port SATA_RXN3
SATA_RXN4: EC28.2 ; port SATA_RXN4
SATA_RXN5: EC43.2 ; port SATA_RXN5
SATA_RXP3: EC40.2 ; port SATA_RXP3
SATA_RXP4: EC27.2 ; port SATA_RXP4
SATA_RXP5: EC44.2 ; port SATA_RXP5
SATA_TXN3: EC38.2 ; port SATA_TXN3
SATA_TXN4: EC26.2 ; port SATA_TXN4
SATA_TXN5: EC42.2 ; port SATA_TXN5
SATA_TXP3: EC37.2 ; port SATA_TXP3
SATA_TXP4: EC25.2 ; port SATA_TXP4
SATA_TXP5: EC41.2 ; port SATA_TXP5
SRCCLKREQ6#: SSD2.52(CLKREQ/NC) ; port SRCCLKREQ6#
NetEC25_1: EC25.1 PU16.17(B1_P)
NetEC26_1: EC26.1 PU16.16(B1_N)
NetEC27_1: EC27.1 PU16.18(B0_N)
NetEC28_1: EC28.1 PU16.19(B0_P)
NetEC37_1: EC37.1 SATA3.2(TX+_(I))
NetEC38_1: EC38.1 SATA3.3(TX-_(I))
NetEC39_1: EC39.1 SATA3.5(RX-_(O))
NetEC40_1: EC40.1 SATA3.6(RX+_(O))
NetEC41_1: EC41.1 SATA4.2(TX+_(I))
NetEC42_1: EC42.1 SATA4.3(TX-_(I))
NetEC43_1: EC43.1 SATA4.5(RX-_(O))
NetEC44_1: EC44.1 SATA4.6(RX+_(O))
NetEC57_2: EC57.2 SSD2.35(PETN1)
NetEC87_1: EC87.1 PU16.13(C1_P)
NetEC110_2: EC110.2 SSD2.37(PETP1)
NetEC112_2: EC112.2 SSD2.25(PETP2)
NetEC115_2: EC115.2 SSD2.23(PETN2)
NetEC116_2: EC116.2 SSD2.11(PETN3)
NetEC119_2: EC119.2 SSD2.13(PETP3)
NetEC120_1: EC120.1 PU16.12(C1_N)

Not connected (* = marked no-connect by the designer): SSD2 6(NC1) 8(NC2) 20(NC3) 22(NC4) 24(NC5) 26(NC6) 28(NC7) 30(NC8) 32(NC9) 34(NC10) 36(NC11) 38(DEVSLP) 40(NC12) 42(NC13) 44(NC14) 46(NC15) 48(NC16) 54(PEWAKE/NC) 56(NC17) 58(NC18) 67(NC19) 68(SUSCLK)

### Notes on the sheet
- 0 - SATA
- 1 - PCIE
- (near EC37) 0 A TO B
  1 A TO C
- 更新日期
- 2025-10-09
- 原理图
- 图页
- 创建日期
- 物料编码
- 审阅
- 绘制
- 【全网首发】X86电脑主板_copy
- 版本
- V1.0
- 尺寸
- A3
- 页
- 0
- 嘉立创EDA
- 共
- 18
- (in symbol 91302-67-067R2M) KEY M

### Library data of the parts
C325 C326 C333 C350 = CL05B104KO5NNNC: as C237-C240 on sheet LAN - RTL8111H; Device: CL05B104KO5NNNC; Value: 100nF; Supplier: LCSC; Datasheet: https://atta.szlcsc.com/upload/public/pdf/source/20160103/1457707674891.pdf; SupplierPart: C1525; ConvertToPcb: yes; LCSC Part Name: 100nF ±10% 16V; JLCPCB Part Class: Basic Part; ManufacturerPart: CL05B104KO5NNNC; Supplier Footprint: 0402
  C325: FootprintName: C0402_1
  C326 C350: FootprintName: C0402_2
  C333: FootprintName: C0402_3
C330 = CL10A226MQ8NRNC: 容值:22uF;精度:±20%;额定电压:6.3V;材质(温度系数):X5R;; Manufacturer: SAMSUNG(三星); Symbol: C0805; AddInBom: yes; Tolerance: ±20%; Voltage Rated: 6.3V; Temperature Coefficient: X5R; ModelId: ac125912035d415993ca9572d50418b1; ModelName: C0603_L1.6-W0.8-H0.8; ModelTransform: 62.992,31.496,0,0,0,0,0,0,0; Device: CL10A226MQ8NRNC; Value: 22uF; LCSC Part Name: 22uF ±20% 6.3V; SupplierPart: C59461; ManufacturerPart: CL10A226MQ8NRNC; Supplier Footprint: 0603; JLCPCB Part Class: Basic Part; Datasheet: https://atta.szlcsc.com/upload/public/pdf/source/20160218/1457707763339.pdf; Supplier: LCSC; ConvertToPcb: yes; FootprintName: C0603_3
C334 = CL05B104KO5NNNC: 容值:100nF;精度:±10%;额定电压:16V;材质(温度系数):X7R;; Manufacturer: SAMSUNG(三星); ModelId: 36a51122f27c49738f86b3bfa98863e0; Tolerance: ±10%; AddInBom: yes; Voltage Rated: 16V; ModelName: C0402_L1.0-W0.5-H0.5; ModelTransform: 39.37,19.685,0,0,0,0,0,0,0; Temperature Coefficient: X7R; Device: CL05B104KO5NNNC; Symbol: C0402; Value: 100nF; Supplier: LCSC; Datasheet: https://atta.szlcsc.com/upload/public/pdf/source/20160103/1457707674891.pdf; FootprintName: C0402; SupplierPart: C1525; ConvertToPcb: yes; LCSC Part Name: 100nF ±10% 16V; JLCPCB Part Class: Basic Part; ManufacturerPart: CL05B104KO5NNNC; Supplier Footprint: 0402
CN1-CN3 = SMTSOM270BTR: Manufacturer: YIYUAN(怡远); AddInBom: yes; ModelId: 61ebfd53fc244f4ca2ca3f0eff083064; ModelTransform: 218.6896,218.87854,0,0,0,0,0,0,-60.2361; Symbol: SMTSOM270BTR; Device: SMTSOM270BTR; LCSC Part Name: YIYUAN(怡远)M2 贴片螺母 L=7mm铜镀锡SMTSOM270BTR; SupplierPart: C5301781; ManufacturerPart: SMTSOM270BTR; Supplier Footprint: M2; JLCPCB Part Class: Extended Part; Datasheet: https://atta.szlcsc.com/upload/public/pdf/source/20230202/A42D22DA7D93D728E13784C4003E4077.pdf; Supplier: LCSC; ConvertToPcb: yes; FootprintName: SMD_BD5.6-D3.6; ModelName: SMD_BD5.6-D3.6
EC25-EC28 EC37-EC44 = CL05B103KB5NNNC: 容值:10nF;精度:±10%;额定电压:50V;材质(温度系数):X7R;; Manufacturer: SAMSUNG(三星); Symbol: CAP_3; ModelId: 36a51122f27c49738f86b3bfa98863e0; Tolerance: ±10%; AddInBom: yes; Voltage Rated: 50V; ModelName: C0402_L1.0-W0.5-H0.5; ModelTransform: 39.37,19.685,0,0,0,0,0,0,0; Temperature Coefficient: X7R; Device: CL05B103KB5NNNC; Value: 10nF; Supplier: LCSC; Datasheet: https://atta.szlcsc.com/upload/public/pdf/source/20160103/1457707674468.pdf; SupplierPart: C15195; ConvertToPcb: yes; LCSC Part Name: 10nF ±10% 50V; JLCPCB Part Class: Basic Part; ManufacturerPart: CL05B103KB5NNNC; Supplier Footprint: 0402
  EC25-EC28: FootprintName: C0402_1
  EC37-EC44: FootprintName: C0402_2
EC57 EC87 EC110 EC112 EC115 EC116 EC119 EC120 = CL05B224KO5NNNC: 容值:220nF;精度:±10%;额定电压:16V;材质(温度系数):X7R;; Manufacturer: SAMSUNG(三星); Symbol: CAP_3; ModelId: 36a51122f27c49738f86b3bfa98863e0; Tolerance: ±10%; AddInBom: yes; Voltage Rated: 16V; ModelName: C0402_L1.0-W0.5-H0.5; ModelTransform: 39.37,19.685,0,0,0,0,0,0,0; Temperature Coefficient: X7R; Device: CL05B224KO5NNNC; Value: 220nF; Supplier: LCSC; Datasheet: https://atta.szlcsc.com/upload/public/pdf/source/20160103/1457707689724.pdf; SupplierPart: C16772; ConvertToPcb: yes; LCSC Part Name: 220nF ±10% 16V; JLCPCB Part Class: Basic Part; ManufacturerPart: CL05B224KO5NNNC; Supplier Footprint: 0402
  EC57 EC110 EC112 EC115 EC116 EC119: FootprintName: C0402_2
  EC87 EC120: FootprintName: C0402_1
PU16 = CBTL02043ABQ,115: 通道数:2;; Manufacturer: NXP(恩智浦); Symbol: RT9173B_1; AddInBom: yes; ModelId: 918c0b6f6ee34a00ac61cad91f9c3b79; ModelName: DHVQFN-20_L4.5-W2.5-H1.0-P0.50; ModelTransform: 177.952,99.2124,0,0,0,0,0,0,0; Number of Channels: 2; Supply Voltage: 3V~3.6V; Device: CBTL02043ABQ,115; LCSC Part Name: CBTL02043ABQ,115; SupplierPart: C2652457; ManufacturerPart: CBTL02043ABQ,115; Supplier Footprint: DHVQFN-20(2.5x4.5); JLCPCB Part Class: Extended Part; Datasheet: https://atta.szlcsc.com/upload/public/pdf/source/20210610/90394DED433530325F9420CC6CAD8C68.pdf; Supplier: LCSC; ConvertToPcb: yes; FootprintName: DHVQFN20
SATA3 SATA4 = LE18077-Z54D-4H: 连接器类型:SATA;间距:1.27mm;引脚总数:7P;安装方式:直插;工作温度范围:-;; Manufacturer: FOXCONN(富士康); Symbol: CON_SATA_0; AddInBom: yes; ModelId: 0436eca5925c4476b8c12039190a48c8; ModelName: CONN-TH_LE18077-Z54D-4H; ModelTransform: 664.5656,253.9365,0,0,0,0,2.126,-29.529,-137.795; Connector Type: SATA; Pitch: 1.27mm; Device: LE18077-Z54D-4H; JLCPCB Part Class: Extended Part; LCSC Part Name: 1.27mm P数:7P; SupplierPart: C2760977; ManufacturerPart: LE18077-Z54D-4H; Supplier Footprint: 插件,P=1.27mm; Datasheet: https://atta.szlcsc.com/upload/public/pdf/source/20210311/C2760977_52C78B253FD0431A57C5EE5E2D3B95F9.pdf; Supplier: LCSC; ConvertToPcb: yes; FootprintName: SATA_D_AKL; Number of Pins: 7P; Mounting Style: 直插; Height Above Board: 8.4mm; Operating Temperature Range: -
SSD2 = 91302-67-067R2M: 连接器类型:M.2;间距:0.5mm;引脚总数:67P;安装方式:卧贴;工作温度范围:-40℃~+80℃;; Manufacturer: UMaxconn(友贸); Symbol: NGFF-M_0; AddInBom: yes; ModelId: 59b61bd22b3246afa28dfa3f08f936f5; ModelName: PCIE-M-KEY_91302-67-067R2M; ModelTransform: 860.628,280.3144,0,0,0,0,0,9.842,-19.685; Connector Type: M.2; Pitch: 0.5mm; Device: 91302-67-067R2M; LCSC Part Name: 0.5mm P数:67P; SupplierPart: C2922445; ManufacturerPart: 91302-67-067R2M; Supplier Footprint: SMD,P=0.5mm,卧贴; JLCPCB Part Class: Extended Part; Datasheet: https://atta.szlcsc.com/upload/public/pdf/source/20211119/A0E352E9B49FDCBBE6601CEA31B5A16F.pdf; Supplier: LCSC; ConvertToPcb: yes; FootprintName: SMD-NGFF-75P-M2-H3-LOTES; Number of Pins: 67P; Mounting Style: 卧贴; Height Above Board: 6.7mm; Contact Material: 铜合金; Contact Plating: 金; Operating Temperature Range: -40℃~+80℃
YR79 = 0402WGF4701TCE: 电阻类型:厚膜电阻;阻值:4.7kΩ;精度:±1%;功率:62.5mW;; Manufacturer: UNI-ROYAL(厚声); Symbol: R-0603; ModelId: 671aefced39d4c318694bba8bd8efd39; Tolerance: ±1%; AddInBom: yes; Power(Watts): 62.5mW; ModelName: R0402_L1.0-W0.5-H0.5; ModelTransform: 39.37,19.685,0,0,0,0,0,0.0005,0; Overload Voltage (Max): 50V; Temperature Coefficient: ±100ppm/℃; Device: 0402WGF4701TCE; Value: 4.7kΩ; Type: 厚膜电阻; Supplier: LCSC; Datasheet: https://atta.szlcsc.com/upload/public/pdf/source/20200306/C422600_1E6D84923E4A46A82E41ADD87F860B5C.pdf; FootprintName: R0402; SupplierPart: C25900; ConvertToPcb: yes; LCSC Part Name: 4.7kΩ ±1% 62.5mW; JLCPCB Part Class: Basic Part; ManufacturerPart: 0402WGF4701TCE; Supplier Footprint: 0402; Operating Temperature Range: -55℃~+155℃